# Altium schematic sheet Schematic_Car_Secondary.SchDoc: WackyRacersCar Secondary
size A3; DrawnBy: Group 26; Address1: ECE Department; Address2: University of Canterbury; Address3: Christchurch 8041; Address4: New Zealand; Revision: 1; SheetNumber: 2; SheetTotal: 2; ImagePath: \\maxwell\elecapp\AltiumDesigner\Templates\uc-logo.png
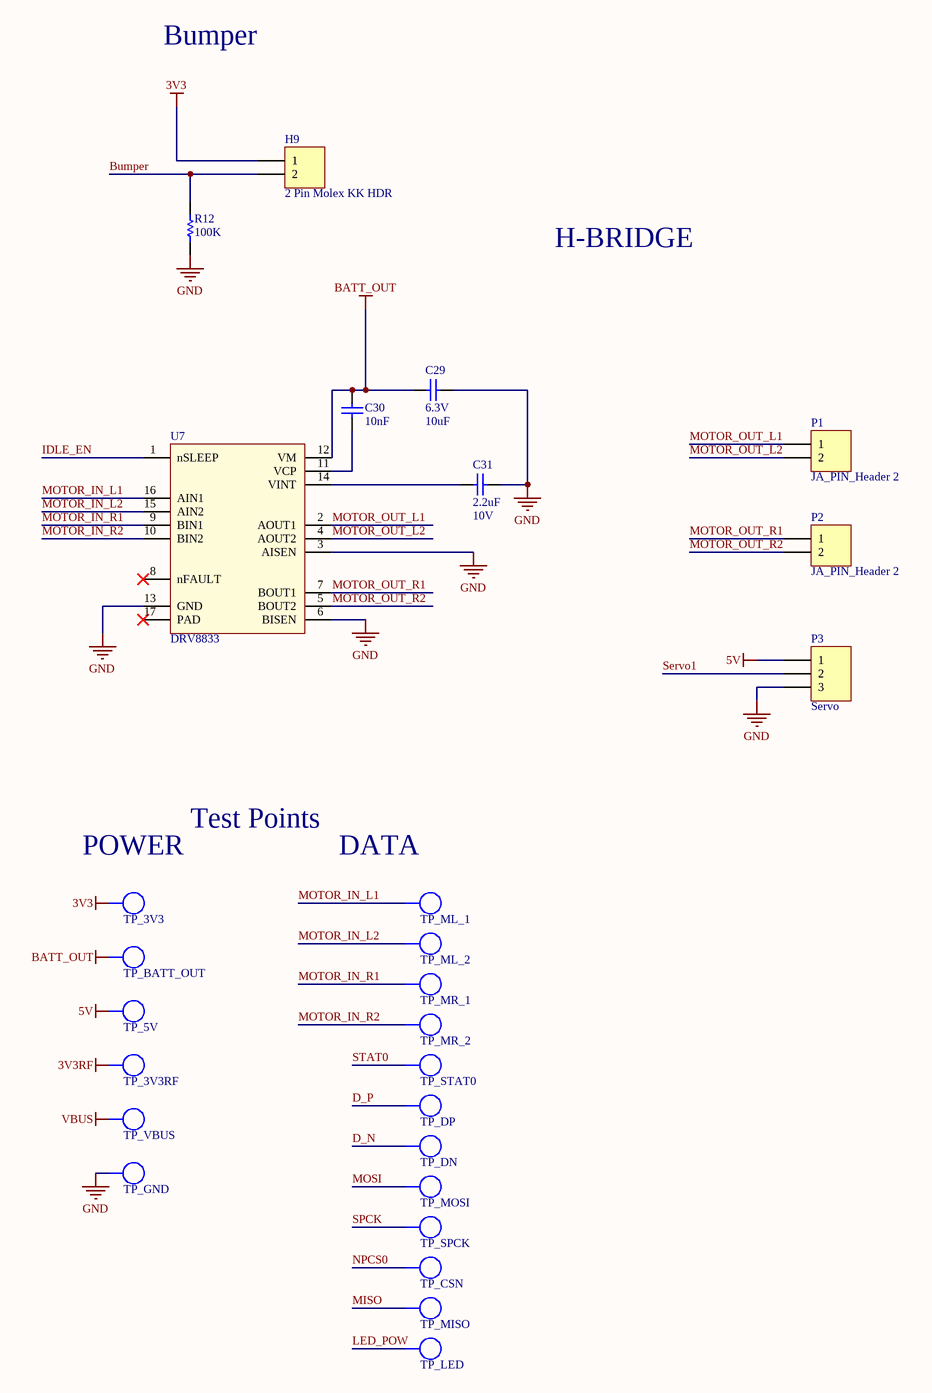
[diagram p0: Schematic_Car_Secondary.SchDoc]

## Parts
C29  Voltage - Rated: 6.3V  [CAPC1608L]  (hidden comment: 10uF)
C30  10nF  [CAPC1608L]
C31  Max Voltage: 10V  [CAPC1608L]  (hidden comment: 2.2uF)
H9  2 Pin Molex KK HDR  [MOLEX_KK_2_HDR]
P1  JA_PIN_Header 2  [HDR1X2]
P2  JA_PIN_Header 2  [HDR1X2]
P3  Servo  [HDR1X3]
R12  100K  [RESC1608L]
TP_3V3  3V3  [TP_1206]  (value not drawn)  (no BOM)
TP_3V3RF  3V3RF  [TP_1206]  (value not drawn)  (no BOM)
TP_5V  5V  [TP_1206]  (value not drawn)  (no BOM)
TP_BATT_OUT  BATT_OUT  [TP_1206]  (value not drawn)  (no BOM)
TP_CSN  CSN  [TP_1206]  (value not drawn)  (no BOM)
TP_DN  DN  [TP_1206]  (value not drawn)  (no BOM)
TP_DP  DP  [TP_1206]  (value not drawn)  (no BOM)
TP_GND  GND  [TP_1206]  (value not drawn)  (no BOM)
TP_LED  LED  [TP_1206]  (value not drawn)  (no BOM)
TP_MISO  MISO  [TP_1206]  (value not drawn)  (no BOM)
TP_ML_1  L1  [TP_1206]  (value not drawn)  (no BOM)
TP_ML_2  L2  [TP_1206]  (value not drawn)  (no BOM)
TP_MOSI  MOSI  [TP_1206]  (value not drawn)  (no BOM)
TP_MR_1  R1  [TP_1206]  (value not drawn)  (no BOM)
TP_MR_2  R2  [TP_1206]  (value not drawn)  (no BOM)
TP_SPCK  SPCK  [TP_1206]  (value not drawn)  (no BOM)
TP_STAT0  STAT0  [TP_1206]  (value not drawn)  (no BOM)
TP_VBUS  VBUS  [TP_1206]  (value not drawn)  (no BOM)
U7  DRV8833  [HTSOP16 DRV8833]

## Nets
3V3: H9.1 TP_3V3.1
3V3RF: TP_3V3RF.1
5V: P3.1 TP_5V.1
BATT_OUT: C29.1 C30.2 TP_BATT_OUT.1 U7.12(VM)
GND: C29.2 C31.1 P3.3 R12.1 TP_GND.1 U7.3(AISEN) U7.6(BISEN) U7.13(GND)
VBUS: TP_VBUS.1
Bumper: H9.2 R12.2
D_N: TP_DN.1
D_P: TP_DP.1
IDLE_EN: U7.1(nSLEEP)
LED_POW: TP_LED.1
MISO: TP_MISO.1
MOSI: TP_MOSI.1
MOTOR_IN_L1: TP_ML_1.1 U7.16(AIN1)
MOTOR_IN_L2: TP_ML_2.1 U7.15(AIN2)
MOTOR_IN_R1: TP_MR_1.1 U7.9(BIN1)
MOTOR_IN_R2: TP_MR_2.1 U7.10(BIN2)
MOTOR_OUT_L1: P1.1 U7.2(AOUT1)
MOTOR_OUT_L2: P1.2 U7.4(AOUT2)
MOTOR_OUT_R1: P2.1 U7.7(BOUT1)
MOTOR_OUT_R2: P2.2 U7.5(BOUT2)
NPCS0: TP_CSN.1
Servo1: P3.2
SPCK: TP_SPCK.1
STAT0: TP_STAT0.1
NetC30_1: C30.1 U7.11(VCP)
NetC31_2: C31.2 U7.14(VINT)

Not connected (* = marked no-connect by the designer): U7 8(nFAULT)* 17(PAD)*

## Notes on the sheet
- Bumper
- H-BRIDGE
- (near TP_3V3) POWER
- Test Points
- (near TP_ML_1) DATA
- Title
- Drawn by:
- Date:
- Time:
- Revision:
- Sheet
- of
- File:

## Library data of the parts
C29 = CC_10uF_0603: CAP CER 10UF X5R +-20% 6V3 0603; Supplier: ECE Dept; Storage Location: PCB Assembly WS; Value: 10uF
C30 = CC_10nF_0603: CAP CER 10nF X7R +-10% 50V 0603; PackageReference: 0603; Code_IPC: 1608 [0603]; Verify: *; Supplier: ECE Dept; Storage Location: PCB Assembly WS; Value: 10nF
C31 = CC_2.2uF_0603: CAP CER 2.2uF X5R +-20% 10V 0603; PackageReference: 0603; Code_IPC: 1608 [0603]; Verify: *; Supplier: ECE Dept; Storage Location: PCB Assembly WS; Value: 2.2uF
H9 = JA_MOLEX_KK_2POS: CONN HEADER 2POS 2.54mm VERT_Thru Hole; Supplier 1: Farnell; Supplier Part Number 1: 1462926; Supplier: ECE Dept; Storage Location: ECE Dept Store; Value: 2 Pin Molex KK HDR
P1 P2 = JA_PIN_Header 2: Header, 2-Pin; LatestRevisionDate: 17-Jul-2002; LatestRevisionNote: Re-released for DXP Platform.; Publisher: Altium Limited
P3 = JA_PIN_Header 3: Header, 3-Pin; LatestRevisionDate: 17-Jul-2002; LatestRevisionNote: Re-released for DXP Platform.; Publisher: Altium Limited
R12 = RS_100K: RES 100K OHM 1/10W 5% 0603 SMD; Storage Location: PCB Assembly WS; Supplier: ECE Dept; Value: 100K
TP_3V3 TP_3V3RF TP_5V TP_BATT_OUT TP_CSN TP_DN TP_DP TP_GND TP_LED TP_MISO TP_ML_1 TP_ML_2 TP_MOSI TP_MR_1 TP_MR_2 TP_SPCK TP_STAT0 TP_VBUS = TP_1206: Test-Point 3.3x1.6x2.1mm SMD; Manufacturer: Harwin Inc; Manufacturer Part Number: S1751-46R; Value: TP; Manufacturer PN: *; Storage Location: ProtoPlace; Mounting Type: Surface Mount; Type: PC Test Point; Supplier 1: Digi-Key; Supplier Part Number 1: 952-1478-2-ND; Supplier 2: Farnell; Supplier Part Number 2: 1826282; Supplier: ECE Dept
U7 = DRV8833: Dual H-Bridge Motor Driver 1.5A; ComponentLink1Description: DRV8833 Datasheet; ComponentLink1URL: \\maxwell\elecapp\AltiumDesigner\Libraries\DatasheetsNew\ENCE461\drv8833pwpr.pdf